# Altium schematic sheet Soft_Start.SchDoc
size B; SheetNumber: 3; SheetTotal: 3
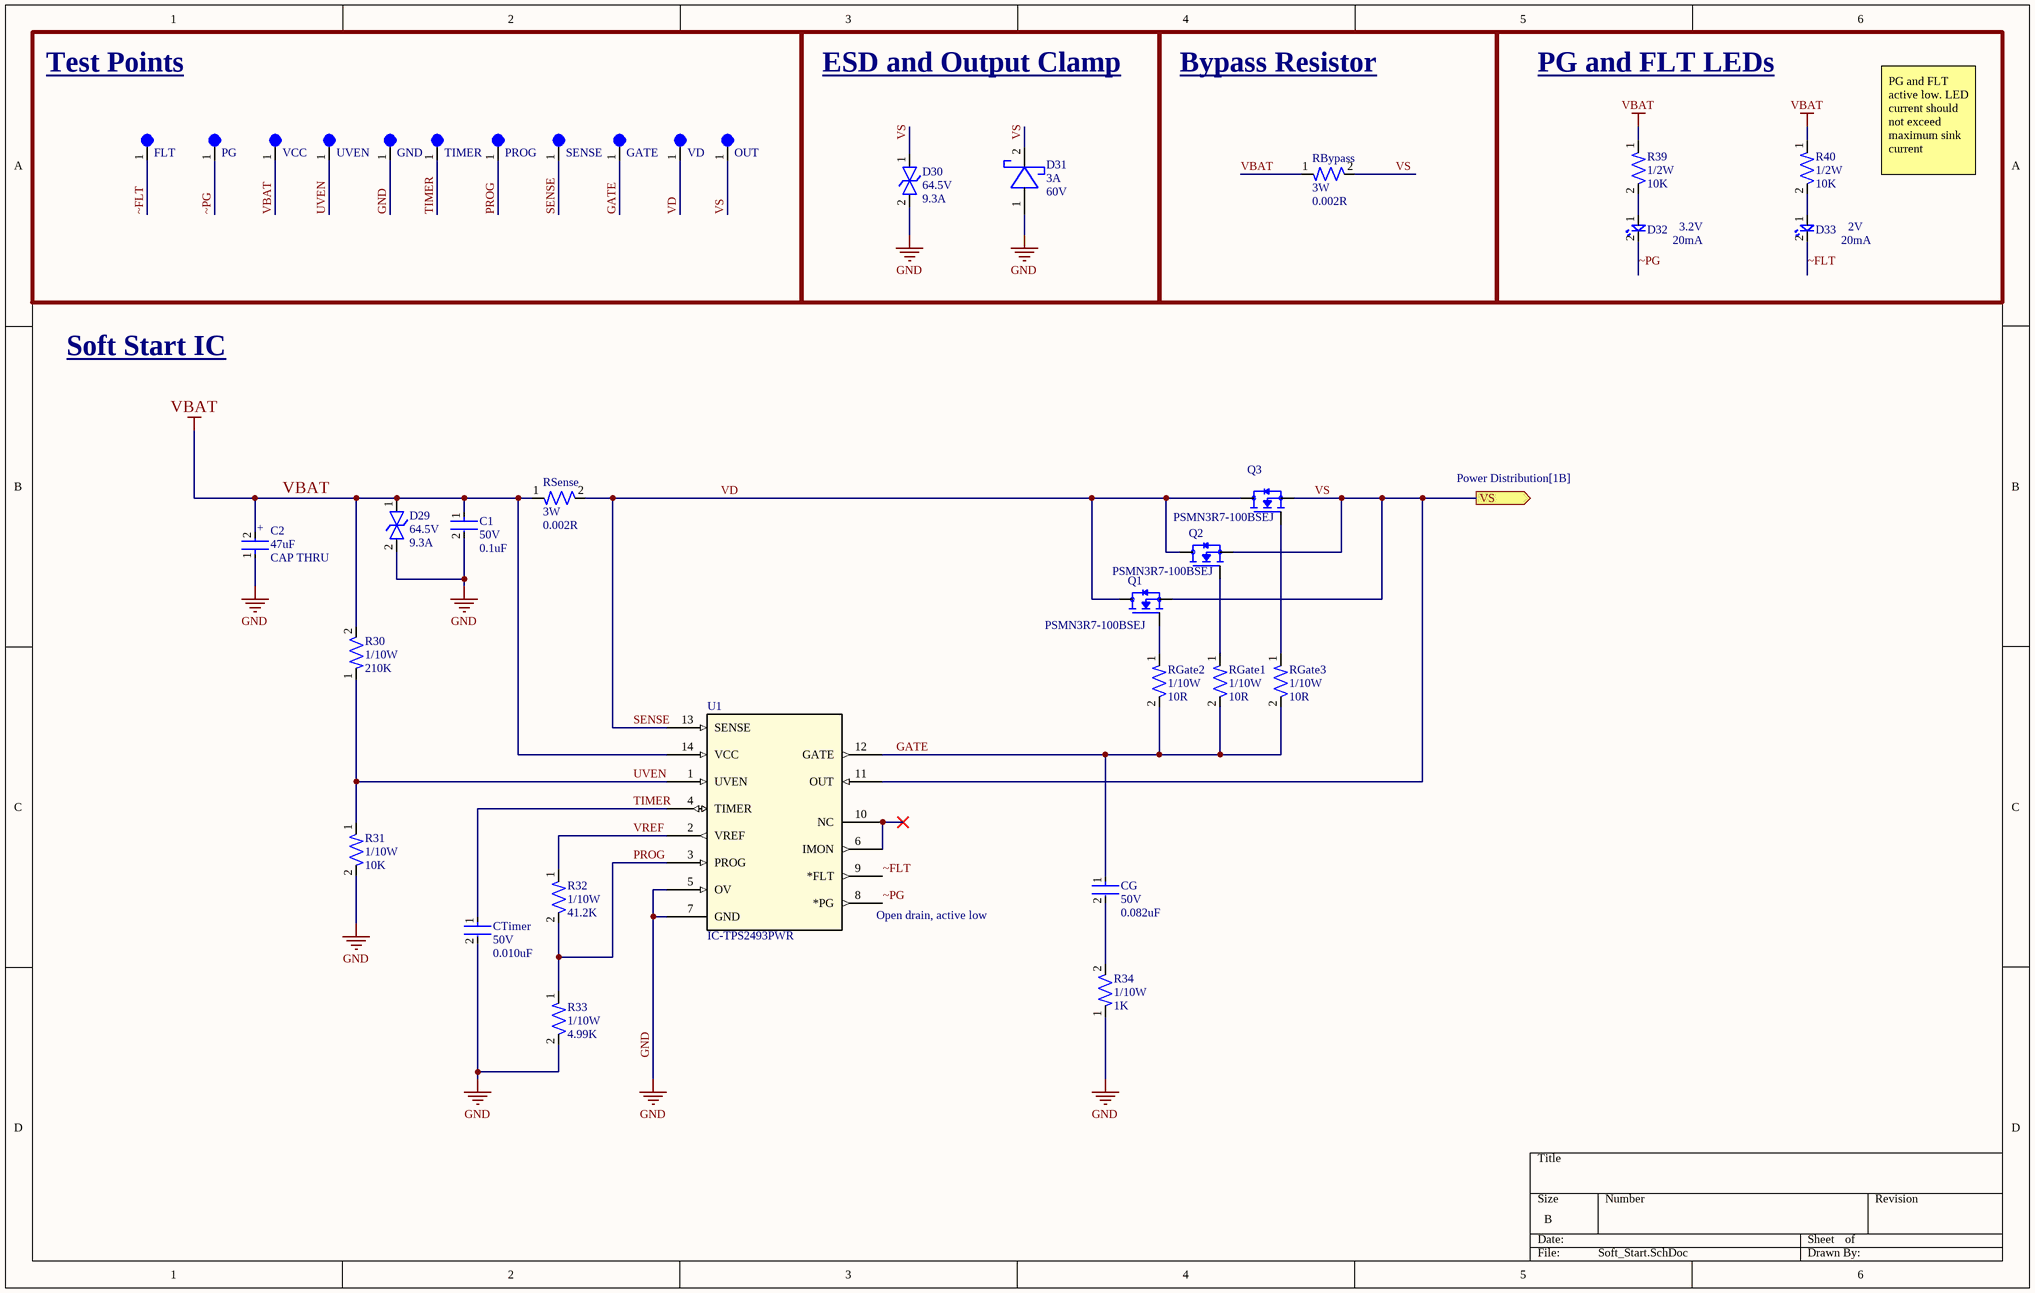
[diagram p0: Soft_Start.SchDoc]

## Parts
C1  Voltage Rating: 50V  Capacitance: 0.1uF  [CAP-0603]  (hidden comment: GRM1885C1H103JA01D)
C2  CAP THRU  value 47uF  [WCAP-ATUL_8X11.5(DXL)]
CG  Voltage Rating: 50V  Capacitance: 0.082uF  [CAP-1206]  (hidden comment: CAP 1206)
CTimer  Voltage Rating: 50V  Capacitance: 0.010uF  [CAP-0603]  (hidden comment: CAP 0603)
D29  Voltage Rating: 64.5V  Current Rating: 9.3A  [DO-214AA (SMBJ)]  (hidden comment: SMBJ40CA)
D30  Voltage Rating: 64.5V  Current Rating: 9.3A  [DO-214AA (SMBJ)]  (hidden comment: SMBJ40CA)
D31  Current Rating: 3A  Reverse Voltage: 60V  [DIO-SOD128]  (hidden comment: PMEG6030EP,115)
D32  Voltage: 3.2V  Current: 20mA  [WL-SMCW_0603]  (hidden comment: 150060GS75000)
D33  Voltage: 2V  Current: 20mA  [WL-SMCW_0603]  (hidden comment: LTST-C191KRKT)
FLT  5003  [TEST-POINT-0001]  (value not drawn)
GATE  5003  [TEST-POINT-0001]  (value not drawn)
GND  5003  [TEST-POINT-0001]  (value not drawn)
OUT  5003  [TEST-POINT-0001]  (value not drawn)
PG  5003  [TEST-POINT-0001]  (value not drawn)
PROG  5003  [TEST-POINT-0001]  (value not drawn)
Q1  PSMN3R7-100BSEJ  [TRANS_PSMN3R7-100BSEJ]
Q2  PSMN3R7-100BSEJ  [TRANS_PSMN3R7-100BSEJ]
Q3  PSMN3R7-100BSEJ  [TRANS_PSMN3R7-100BSEJ]
R30  Wattage: 1/10W  Resistance: 210K  [RES-0603]  (hidden comment: RES 0603)
R31  Wattage: 1/10W  Resistance: 10K  [RES-0603]  (hidden comment: RT0603DRD0710KL)
R32  Wattage: 1/10W  Resistance: 41.2K  [RES-0603]  (hidden comment: ERJ-3EKF4122V)
R33  Wattage: 1/10W  Resistance: 4.99K  [RES-0603]  (hidden comment: ERJ-3EKF2001V)
R34  Wattage: 1/10W  Resistance: 1K  [RES-0603]  (hidden comment: RES 0603)
R39  Wattage: 1/2W  Resistance: 10K  [RES-0805]  (hidden comment: ERJ-P06F1002V)
R40  Wattage: 1/2W  Resistance: 10K  [RES-0805]  (hidden comment: ERJ-P06F1002V)
RBypass  Wattage: 3W  Resistance: 0.002R  [RES-2512]  (hidden comment: RES 2512)
RGate1  Wattage: 1/10W  Resistance: 10R  [RES-0603]  (hidden comment: CRCW060310R0FKEA)
RGate2  Wattage: 1/10W  Resistance: 10R  [RES-0603]  (hidden comment: CRCW060310R0FKEA)
RGate3  Wattage: 1/10W  Resistance: 10R  [RES-0603]  (hidden comment: CRCW060310R0FKEA)
RSense  Wattage: 3W  Resistance: 0.002R  [RES-2512]  (hidden comment: VMS-R010-1.0-U)
SENSE  5003  [TEST-POINT-0001]  (value not drawn)
TIMER  5003  [TEST-POINT-0001]  (value not drawn)
U1  IC-TPS2493PWR  [PW14]
UVEN  5003  [TEST-POINT-0001]  (value not drawn)
VCC  5003  [TEST-POINT-0001]  (value not drawn)
VD  5003  [TEST-POINT-0001]  (value not drawn)

## Blocks framed on the sheet
Test Points: FLT GATE GND OUT PG PROG SENSE TIMER UVEN VCC VD
ESD and Output Clamp: D30 D31
Bypass Resistor: RBypass
PG and FLT LEDs: D32 D33 R39 R40

## Ports
VS (out, see Power Distribution[1B])

## Nets
GND: C1.2 C2.1 CTimer.2 D29.2 D30.2 D31.1(CATHODE) GND.1 R31.2 R33.2 R34.1 U1.5(OV) U1.7(GND)
VBAT: C1.1 C2.2 D29.1 R30.2 R39.1 R40.1 RBypass.1 RSense.1 U1.14(VCC) VCC.1
GATE: CG.1 GATE.1 RGate1.2 RGate2.2 RGate3.2 U1.12(GATE)
PROG: PROG.1 R32.2 R33.1 U1.3(PROG)
SENSE: Q1.MB(D) Q2.MB(D) Q3.MB(D) RSense.2 SENSE.1 U1.13(SENSE) VD.1  [also labelled VD]
TIMER: CTimer.1 TIMER.1 U1.4(TIMER)
UVEN: R30.1 R31.1 U1.1(UVEN) UVEN.1
VREF: R32.1 U1.2(VREF)
VS: D30.1 D31.2(ANODE) OUT.1 Q1.3(S) Q2.3(S) Q3.3(S) RBypass.2 U1.11(OUT) ; port VS
~FLT: D33.2 FLT.1 U1.9(*FLT)
~PG: D32.2 PG.1 U1.8(*PG)
NetCG_2: CG.2 R34.2
NetD32_1: D32.1 R39.2
NetD33_1: D33.1 R40.2
NetQ1_1: Q1.1(G) RGate2.1
NetQ2_1: Q2.1(G) RGate1.1
NetQ3_1: Q3.1(G) RGate3.1
NetU1_6: U1.6(IMON) U1.10(NC)

## Notes on the sheet
- PG and FLT active low. LED current should not exceed maximum sink current
- Soft Start IC
- (near U1) Open drain, active low
- (in symbol CAP THRU) +

## Library data of the parts
C1 CTimer = CAP 0603: 10000 pF ±5% 50V Ceramic Capacitor C0G, NP0 0603 (1608 Metric)
C2 = CAP THRU: 47 µF 100 V Aluminum Electrolytic Capacitors Radial, Can 7000 Hrs @ 105°C; MF: {'manufacturer': u'W\xfcrth Elektronik'}; MP: 860040674004; Package: None; Price: None; Availability: Unavailable
CG = CAP 1206: 0.082 µF ±5% 50V Ceramic Capacitor C0G, NP0 1206 (3216 Metric)
D29 D30 = DIO-TVS-0001: TVS DIODE 40VWM 64.5VC DO214AA; ComponentLink1Description: Datasheet; ComponentLink1URL: https://www.littelfuse.com/media?resourcetype=datasheets&itemid=09a6ae9a-73cb-4ac4-acac-e6dab92ab953&filename=littelfuse_tvs_diode_smbj_datasheet.pdf
D31 = DIO-SCHOTTKY-0003: DIODE SCHOTTKY 60V 3A SOD128; ComponentLink1Description: Datasheet; ComponentLink1URL: https://assets.nexperia.com/documents/data-sheet/PMEG6030EP.pdf
D32 = LED-0002: Green 520nm LED Indication - Discrete 3.2V 0603 (1608 Metric)
D33 = LED-0002: Red 631nm LED Indication - Discrete 2V 0603 (1608 Metric)
FLT GATE GND OUT PG PROG SENSE TIMER UVEN VCC VD = TEST-POINT-0001: Oranange PC Test Point, Miniature Phoisphor Bronze Silver Plating Through Hole Mounting Type
Q1-Q3 = PSMN3R7-100BSEJ: N-Channel 100 V 120A (Ta) 405W (Ta) Surface Mount D2PAK; MF: Nexperia USA Inc.; SnapEDA_Link: https://www.snapeda.com/parts/PSMN3R7-100BSEJ/Nexperia/view-part/?ref=snap; Package: D2PAK-3 Nexperia USA Inc.; Value: *; MP: PSMN3R7-100BSEJ; Check_prices: https://www.snapeda.com/parts/PSMN3R7-100BSEJ/Nexperia/view-part/?ref=eda
R31 = RES 0603: 10 kOhms ±0.5% 0.1W, 1/10W Chip Resistor 0603 (1608 Metric) Thin Film
R32 = RES 0603: 41.2 kOhms ±1% 0.1W, 1/10W Chip Resistor 0603 (1608 Metric) Automotive AEC-Q200 Thick Film
R33 = RES 0603: 4.99 kOhms ±0.1% 0.1W, 1/10W Chip Resistor 0603 (1608 Metric) Anti-Sulfur, Automotive AEC-Q200 Thin Film
R34 = RES 0603: 1 kOhms ±0.1% 0.1W, 1/10W Chip Resistor 0603 (1608 Metric) Anti-Sulfur, Automotive AEC-Q200 Thin Film
R39 R40 = RES 0805: RES SMD 10K OHM 1% 1/2W 0805
RBypass RSense = RES 2512: 2 mOhms ±1% 3W Chip Resistor 2512 (6332 Metric) Automotive AEC-Q200, Current Sense, Moisture Resistant Metal Element
RGate1-RGate3 = RES 0603: 10 Ohms ±1% 0.1W, 1/10W Chip Resistor 0603 (1608 Metric) Automotive AEC-Q200 Thick Film
U1 = IC-TPS2493PWR: 9-V to 80-V hot swap controller with power limiting, Auto Retry and analog current monitor 14-TSSOP -40 to 125; Manufacturer_Name: Texas Instruments; Copyright: Copyright (C) 2026 Ultra Librarian. All rights reserved.; Manufacturer_Part_Number: TPS2493PWR; RefDes: RefDes; Type: Type